# Altium schematic sheet sensors.SchDoc
size A4; SheetNumber: 2; SheetTotal: 3
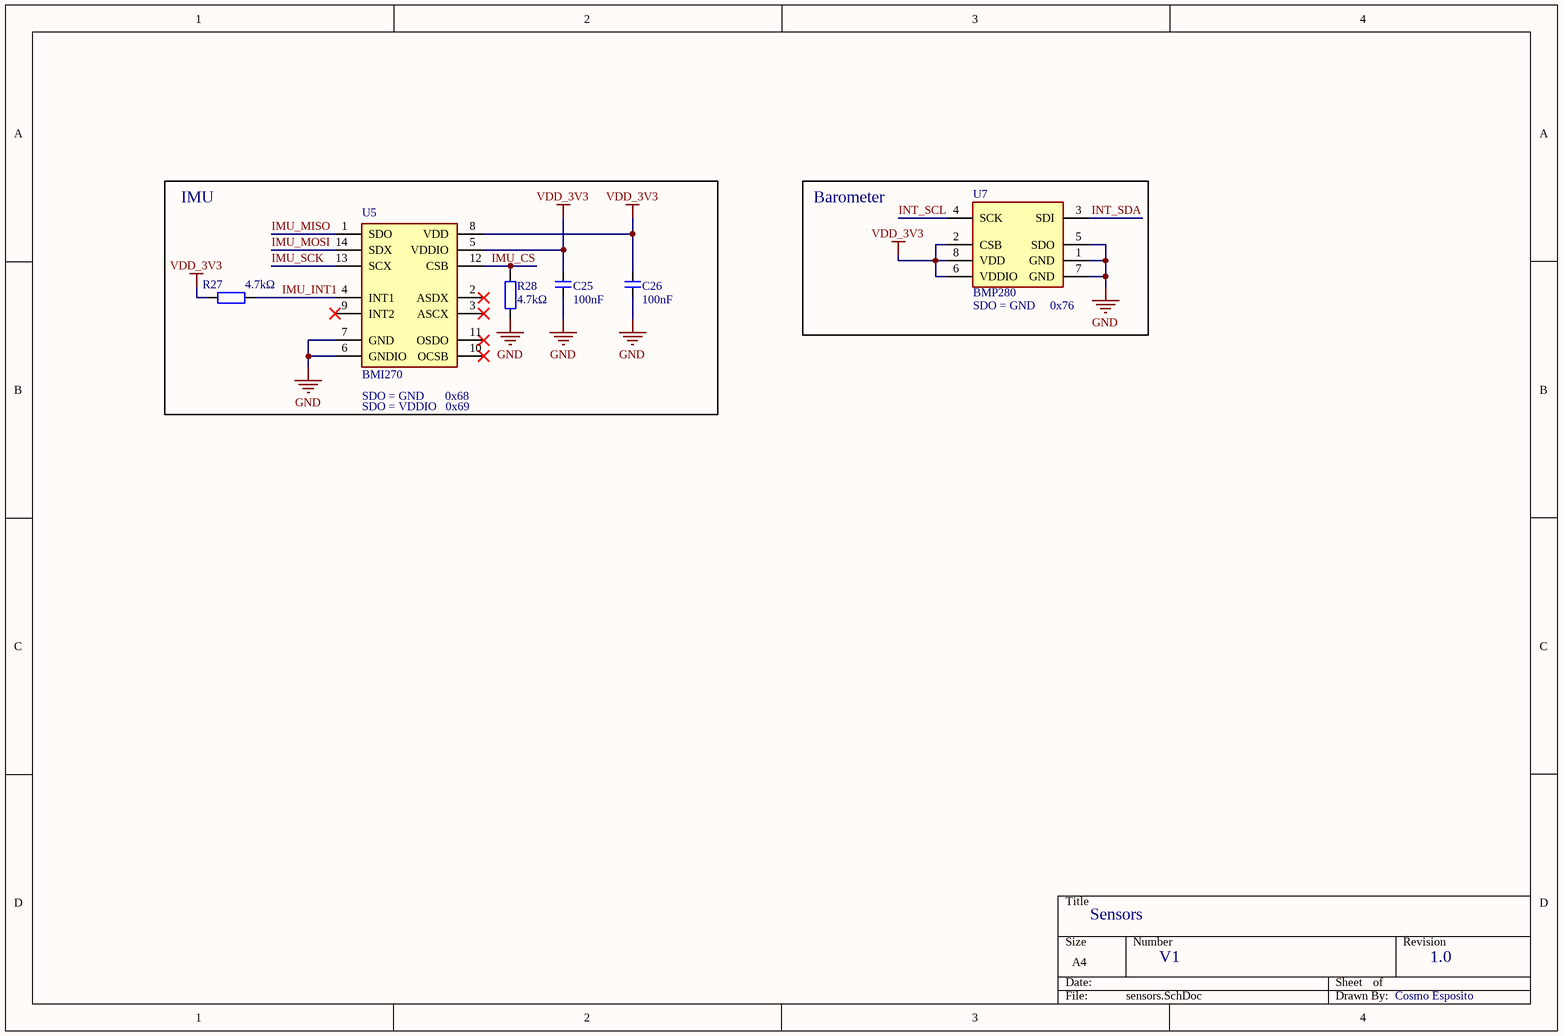
[diagram p0: sensors.SchDoc]

## Parts
C25  100nF  [0402 (1005 metric) CAP IPC-7351 Level B SMD]
C26  100nF  [0402 (1005 metric) CAP IPC-7351 Level B SMD]
R27  4.7kΩ  [0402 (1005 metric) RES IPC-7351 Level B SMD]
R28  4.7kΩ  [0402 (1005 metric) RES IPC-7351 Level B SMD]
U5  BMI270  [BMI270]
U7  BMP280  [BMP280]

## Blocks framed on the sheet
IMU: C25 C26 R27 R28 U5
Barometer: U7

## Nets
GND: C25.1 C26.1 R28.1 U5.6(GNDIO) U5.7(GND) U7.1(GND) U7.5(SDO) U7.7(GND)
VDD_3V3: C25.2 C26.2 R27.2 U5.5(VDDIO) U5.8(VDD) U7.2(CSB) U7.6(VDDIO) U7.8(VDD)
IMU_CS: R28.2 U5.12(CSB)
IMU_INT1: R27.1 U5.4(INT1)
IMU_MISO: U5.1(SDO)
IMU_MOSI: U5.14(SDX)
IMU_SCK: U5.13(SCX)
INT_SCL: U7.4(SCK)
INT_SDA: U7.3(SDI)

Not connected (* = marked no-connect by the designer): U5 2(ASDX)* 3(ASCX)* 9(INT2)* 10(OCSB)* 11(OSDO)*

## Notes on the sheet
- (near U7) SDO = GND     0x76
- (near U5) SDO = GND       0x68
- (near U5) SDO = VDDIO   0x69
- Sensors
- V1
- 1.0
- Cosmo Esposito

## Library data of the parts
C25 C26 = Capacitor Type1: Value: 100nF
R27 R28 = Resistor Type1: Value: 4.7kΩ
U5 = BMI270: IMUs - Inertial Measurement Units Smart Ultra-Low Power Inertial Measurement Unit (IMU) for Wearable Applications; Manufacturer_Name: BOSCH; Geometry.Height: 0.87mm; Manufacturer_Part_Number: BMI270; Mouser Part Number: 262-BMI270; Mouser Price/Stock: https://www.mouser.co.uk/ProductDetail/Bosch-Sensortec/BMI270?qs=u16ybLDytRYIj%252BjQEee88A%3D%3D; Arrow Part Number: BMI270; Arrow Price/Stock: https://www.arrow.com/en/products/bmi270/bosch-sensortec?utm_currency=USD&region=europe; Datasheet Link: https://www.bosch-sensortec.com/media/boschsensortec/downloads/datasheets/bst-bmi270-ds000.pdf
U7 = BMP280: IC; SNSR; DIGITAL; BAROMETRIC PRESSURE SENSOR; LGA8; Manufacturer_Name: Bosch Sensortec; Copyright: Copyright (C) 2026 Ultra Librarian. All rights reserved.; Manufacturer_Part_Number: BMP280; RefDes: RefDes; Type: Type